# EasyEDA Pro project EVA_RT.eprj, board EVA_RT_Suction_Area
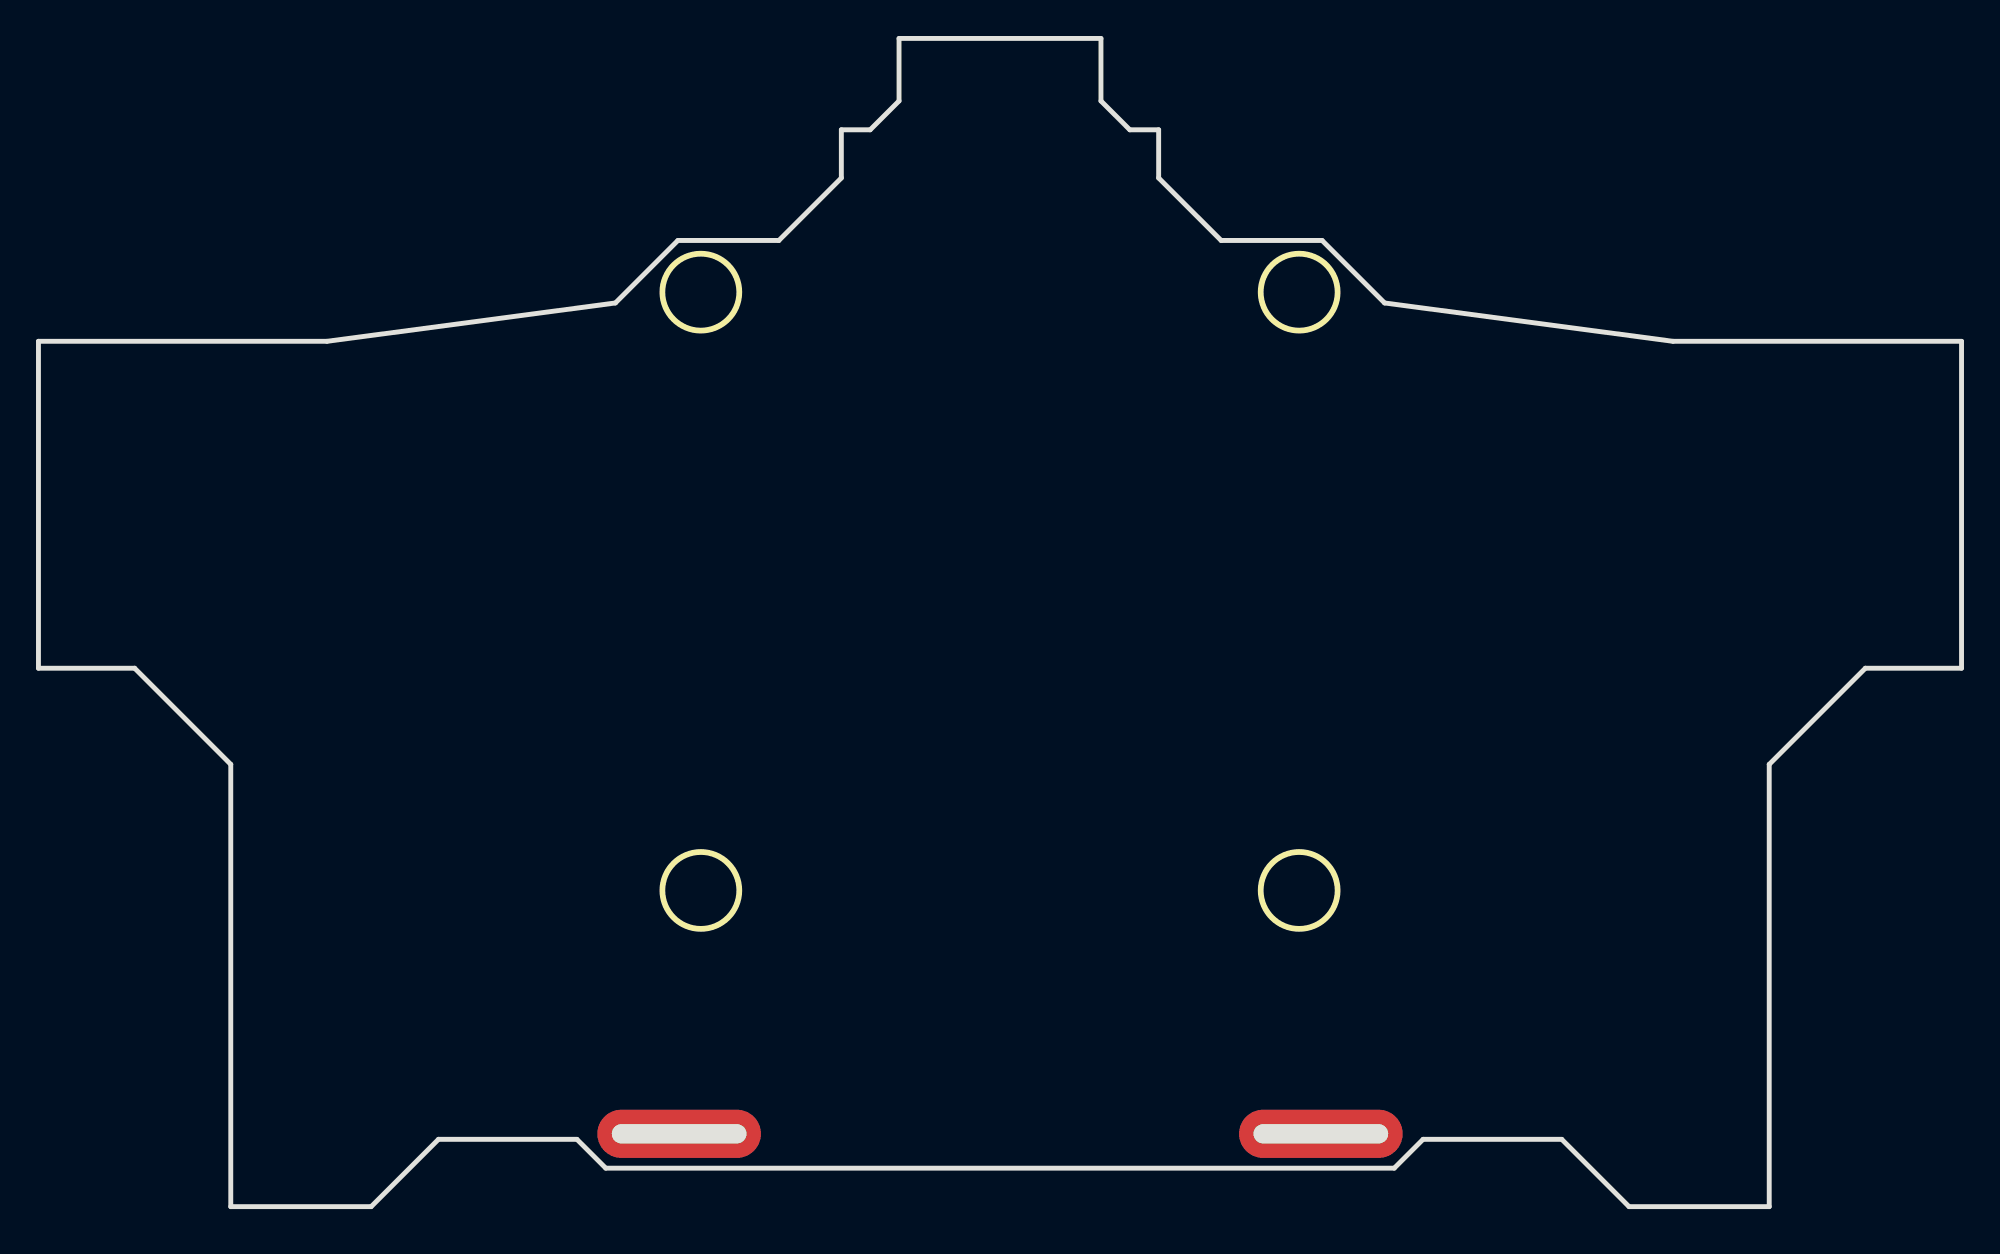
[diagram p10: board, top side]
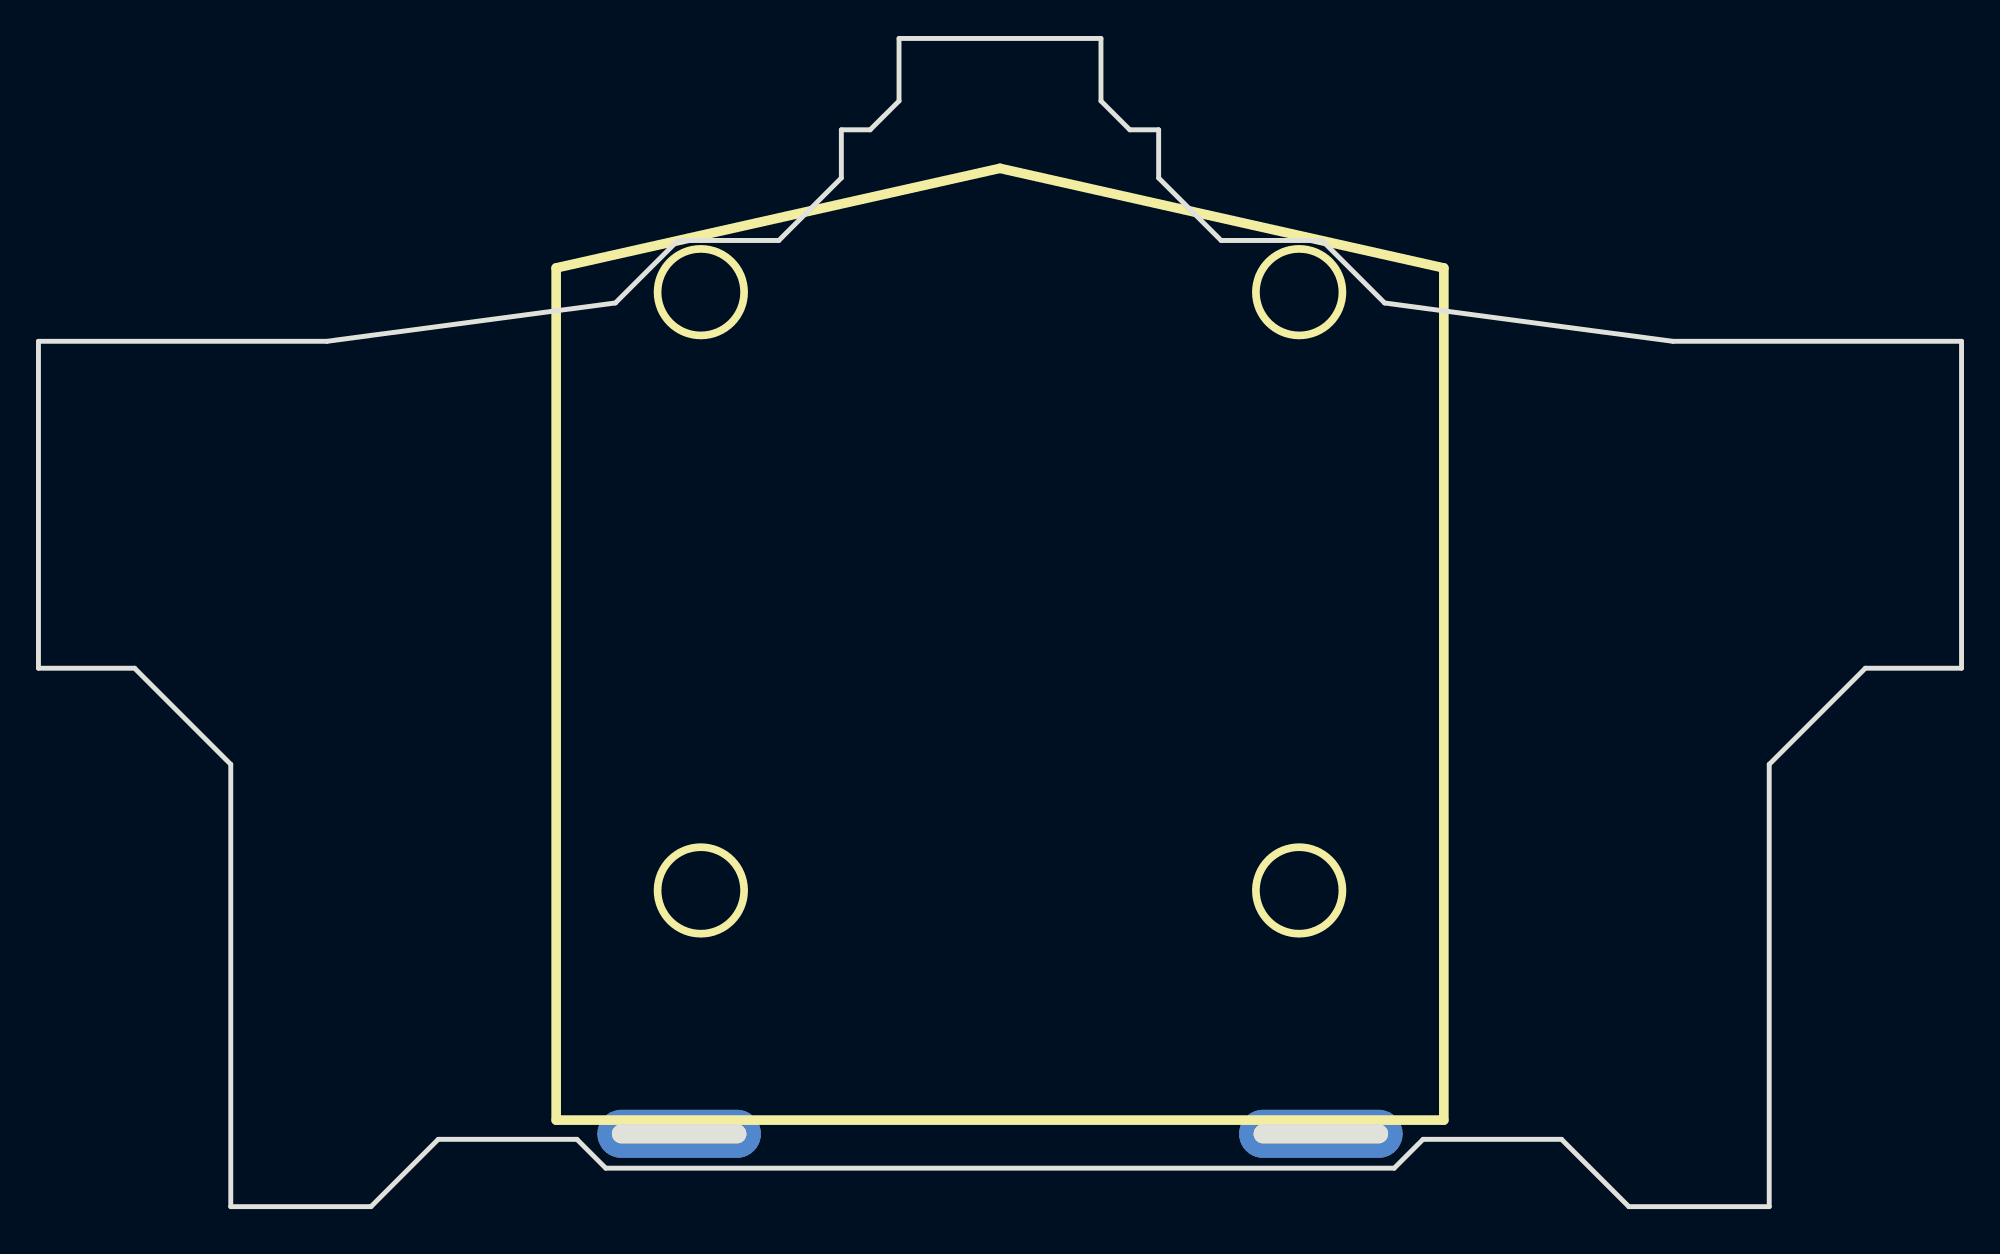
[diagram p11: board, bottom side, seen from below]

Outline 100 x 60.75 mm; copper layers: Top Layer, Bottom Layer. Coordinates in mm from the lower left corner of the outline.
Outline path: 0,45 15,45 30,46.99 33.25,50.24 38.5,50.24 41.75,53.49 41.75,56 43.25,56 44.75,57.5 44.75,60.75 55.25,60.75 55.25,57.5 56.75,56 58.25,56 58.25,53.49 61.5,50.24 66.75,50.24 70,46.99 85,45 100,45 100,28 95,28 90,23 90,0 82.71,0 79.21,3.5 72,3.5 70.5,2 29.5,2 28,3.5 20.8,3.5 17.3,0 10,0 10,23 5,28 0,28 0,45
Stack: Top Layer 0.035mm - / Dielectric1 1.51mm FR4 er 4.5 / Bottom Layer 0.035mm -

## Design rules (mm)
template: JLCPCB Capability(Two Layers Board)
spacing copperThickness1oz (default): track to track 0.102, other pairs 0.152 to 0.3
spacing copperThickness2oz: track to track 0.203, other pairs 0.152 to 0.3
track width copperThickness1oz (default): min 0.127, default 0.254, max 2.54
track width copperThickness2oz: min 0.203, default 0.254, max 2.54
differential pair differentialPair (default): width min 0.127, default 0.254, max 2.54; gap min 0.152, default 0.152
via viaSize (default): diameter min 0.5, default 0.61, max 10; hole min 0.3, default 0.305, max 6.3

## Placement (name value [footprint] x y rotation side)
NOREF  -  [Pad_e55]  66.69 3.79 270 top
NOREF#2  -  [Pad_e56]  33.31 3.79 270 top

## Footprints (pads in the part's own frame, mm; a bottom-side part is the same pattern mirrored in y, then rotated)
Pad_e55
  oval 2.5x8.5 hole 1x7: 1(0,0)
Pad_e56
  oval 2.5x8.5 hole 1x7: 1(0,0)

## Nets

Pads without a net: NOREF 1; NOREF#2 1
